# Altium schematic sheet bank226.SchDoc: Bank226
size A3; Organization: Altium Limited; Address1: L3, 12a Rodborough Rd; Address2: Frenchs Forest; Address3: NSW; Address4: Australia 2086
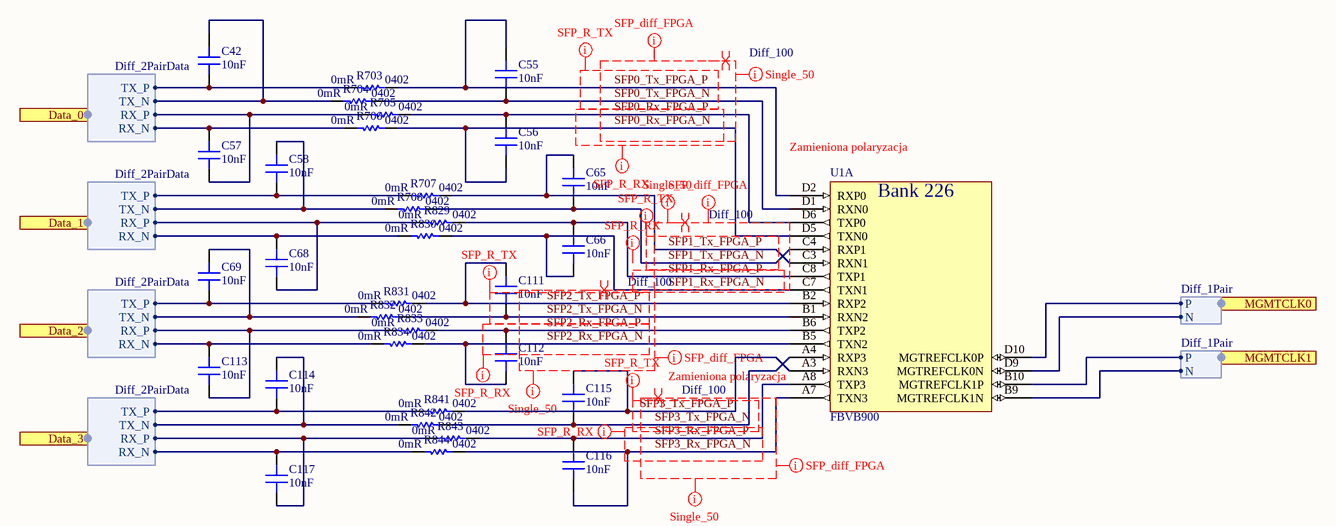
[diagram p0: bank226.SchDoc]

## Parts
C42  10nF  [CAP 0402/1005 KK]
C55  10nF  [CAP 0402/1005 KK]
C56  10nF  [CAP 0402/1005 KK]
C57  10nF  [CAP 0402/1005 KK]
C58  10nF  [CAP 0402/1005 KK]
C65  10nF  [CAP 0402/1005 KK]
C66  10nF  [CAP 0402/1005 KK]
C68  10nF  [CAP 0402/1005 KK]
C69  10nF  [CAP 0402/1005 KK]
C111  10nF  [CAP 0402/1005 KK]
C112  10nF  [CAP 0402/1005 KK]
C113  10nF  [CAP 0402/1005 KK]
C114  10nF  [CAP 0402/1005 KK]
C115  10nF  [CAP 0402/1005 KK]
C116  10nF  [CAP 0402/1005 KK]
C117  10nF  [CAP 0402/1005 KK]
R703  0mR  Case/Package: 0402  [RES 0402/1005 RF KK]
R704  0mR  Case/Package: 0402  [RES 0402/1005 RF KK]
R705  0mR  Case/Package: 0402  [RES 0402/1005 RF KK]
R706  0mR  Case/Package: 0402  [RES 0402/1005 RF KK]
R707  0mR  Case/Package: 0402  [RES 0402/1005 RF KK]
R708  0mR  Case/Package: 0402  [RES 0402/1005 RF KK]
R829  0mR  Case/Package: 0402  [RES 0402/1005 RF KK]
R830  0mR  Case/Package: 0402  [RES 0402/1005 RF KK]
R831  0mR  Case/Package: 0402  [RES 0402/1005 RF KK]
R832  0mR  Case/Package: 0402  [RES 0402/1005 RF KK]
R833  0mR  Case/Package: 0402  [RES 0402/1005 RF KK]
R834  0mR  Case/Package: 0402  [RES 0402/1005 RF KK]
R841  0mR  Case/Package: 0402  [RES 0402/1005 RF KK]
R842  0mR  Case/Package: 0402  [RES 0402/1005 RF KK]
R843  0mR  Case/Package: 0402  [RES 0402/1005 RF KK]
R844  0mR  Case/Package: 0402  [RES 0402/1005 RF KK]
U1  FBVB900  [FBVB900 XX]  (part A of 23)

## Ports
Data_0 (harness Diff_2PairData), Data_1 (harness Diff_2PairData), Data_2 (harness Diff_2PairData), Data_3 (harness Diff_2PairData), MGMTCLK0 (harness Diff_1Pair), MGMTCLK1 (harness Diff_1Pair)

## Harnesses
Diff_2PairData: RX_P, RX_N, TX_P, TX_N
Diff_1Pair: P, N

## Nets
SFP0_Rx_FPGA_N: C56.1 R706.1 U1.D5(TXN0)
SFP0_Rx_FPGA_P: C56.2 R705.1 U1.D6(TXP0)
SFP0_Tx_FPGA_N: C55.1 R704.1 U1.D1(RXN0)
SFP0_Tx_FPGA_P: C55.2 R703.1 U1.D2(RXP0)
SFP1_Rx_FPGA_N: C66.1 R830.1 U1.C7(TXN1)
SFP1_Rx_FPGA_P: C66.2 R829.1 U1.C8(TXP1)
SFP1_Tx_FPGA_N: C65.1 R708.1 U1.C4(RXP1)
SFP1_Tx_FPGA_P: C65.2 R707.1 U1.C3(RXN1)
SFP2_Rx_FPGA_N: C112.1 R834.1 U1.B5(TXN2)
SFP2_Rx_FPGA_P: C112.2 R833.1 U1.B6(TXP2)
SFP2_Tx_FPGA_N: C111.1 R832.1 U1.B1(RXN2)
SFP2_Tx_FPGA_P: C111.2 R831.1 U1.B2(RXP2)
SFP3_Rx_FPGA_N: C116.1 R844.1 U1.A7(TXN3)
SFP3_Rx_FPGA_P: C116.2 R843.1 U1.A8(TXP3)
SFP3_Tx_FPGA_N: C115.1 R842.1 U1.A4(RXP3)
SFP3_Tx_FPGA_P: C115.2 R841.1 U1.A3(RXN3)
NetC42_1: C42.1 R703.2 ; port Data_0.TX_P
NetC42_2: C42.2 R704.2 ; port Data_0.TX_N
NetC57_1: C57.1 R705.2 ; port Data_0.RX_P
NetC57_2: C57.2 R706.2 ; port Data_0.RX_N
NetC58_1: C58.1 R707.2 ; port Data_1.TX_P
NetC58_2: C58.2 R708.2 ; port Data_1.TX_N
NetC68_1: C68.1 R829.2 ; port Data_1.RX_P
NetC68_2: C68.2 R830.2 ; port Data_1.RX_N
NetC69_1: C69.1 R831.2 ; port Data_2.TX_P
NetC69_2: C69.2 R832.2 ; port Data_2.TX_N
NetC113_1: C113.1 R833.2 ; port Data_2.RX_P
NetC113_2: C113.2 R834.2 ; port Data_2.RX_N
NetC114_1: C114.1 R841.2 ; port Data_3.TX_P
NetC114_2: C114.2 R842.2 ; port Data_3.TX_N
NetC117_1: C117.1 R843.2 ; port Data_3.RX_P
NetC117_2: C117.2 R844.2 ; port Data_3.RX_N
NetU1_B9: U1.B9(MGTREFCLK1N) ; port MGMTCLK1.N
NetU1_B10: U1.B10(MGTREFCLK1P) ; port MGMTCLK1.P
NetU1_D9: U1.D9(MGTREFCLK0N) ; port MGMTCLK0.N
NetU1_D10: U1.D10(MGTREFCLK0P) ; port MGMTCLK0.P

## Layout directives
differential pair; differential pair class Diff_100: SFP0_Rx_FPGA_N, SFP0_Rx_FPGA_P, SFP0_Tx_FPGA_N, SFP0_Tx_FPGA_P, SFP1_Rx_FPGA_N, SFP1_Rx_FPGA_P, SFP1_Tx_FPGA_N, SFP1_Tx_FPGA_P, SFP2_Rx_FPGA_N, SFP2_Rx_FPGA_P, SFP2_Tx_FPGA_N, SFP2_Tx_FPGA_P, SFP3_Rx_FPGA_N, SFP3_Rx_FPGA_P, SFP3_Tx_FPGA_N
net class SFP_diff_FPGA: SFP0_Rx_FPGA_N, SFP0_Rx_FPGA_P, SFP0_Tx_FPGA_N, SFP0_Tx_FPGA_P, SFP1_Rx_FPGA_N, SFP1_Rx_FPGA_P, SFP1_Tx_FPGA_N, SFP1_Tx_FPGA_P, SFP2_Rx_FPGA_N, SFP2_Rx_FPGA_P, SFP2_Tx_FPGA_N, SFP2_Tx_FPGA_P, SFP3_Rx_FPGA_N, SFP3_Rx_FPGA_P, SFP3_Tx_FPGA_N
net class Single_50: SFP0_Rx_FPGA_N, SFP0_Rx_FPGA_P, SFP0_Tx_FPGA_N, SFP0_Tx_FPGA_P, SFP1_Rx_FPGA_N, SFP1_Rx_FPGA_P, SFP1_Tx_FPGA_N, SFP1_Tx_FPGA_P, SFP2_Rx_FPGA_N, SFP2_Rx_FPGA_P, SFP2_Tx_FPGA_N, SFP2_Tx_FPGA_P, SFP3_Rx_FPGA_N, SFP3_Rx_FPGA_P, SFP3_Tx_FPGA_N
net class SFP_R_RX: (no net found under the mark), SFP0_Rx_FPGA_N, SFP0_Rx_FPGA_P, SFP2_Rx_FPGA_N, SFP2_Rx_FPGA_P, SFP3_Rx_FPGA_N, SFP3_Rx_FPGA_P
net class SFP_R_TX: SFP0_Tx_FPGA_N, SFP0_Tx_FPGA_P, SFP1_Tx_FPGA_N, SFP1_Tx_FPGA_P, SFP2_Tx_FPGA_N, SFP2_Tx_FPGA_P, SFP3_Tx_FPGA_N, SFP3_Tx_FPGA_P

## Notes on the sheet
- (near U1) Zamieniona polaryzacja
- Title
- Size:
- Date:
- A3
- Number:
- Time:
- Revision:
- Sheet
- of
- File:
- (in symbol FBVB900, part A) Bank 226

## Library data of the parts
C42 C55-C58 C65 C66 C68 C69 C111-C117 = Capacitor: Manufacturer: KEMET; Manufacturer Part Number: C0402C103K4RACTU; Dielectric Material: Ceramic; Tolerance: 10%; Voltage Rating (DC): 16V; Dielectric: X7R; Dissipation Factor: 3.5%; Supplier 1: Digi-Key; Supplier Part Number 1: 399-1038-1-ND; Stock 1: 1112674; Pricing 1: 1 = 0,10000, 10 = 0,02800, 100 = 0,01240, 500 = 0,00886, 1000 = 0,00696, 2500 = 0,00632, 5000 = 0,00582 (USD); RoHS: Yes; Mount: Surface Mount,PCB; Case/Package: 0402; Number of Pins: 2; Case Code (Metric): 1005; Case Code (Imperial): 0402; Contact Plating: Tin,Matte; Min Operating Temperature: -55°C; Max Operating Temperature: 125°C; Capacitance: 10nF; Packaging: Tape and Reel; Package Quantity: 1; Voltage Rating: 16V; Termination: SMD/SMT; Voltage: 16V; Length: 1mm; Height: 0.5mm; Width: 0.02inch; Depth: 0.5mm; Thickness: 0.022inch; Lead Pitch: 0.3mm; Radiation Hardening: No; REACH SVHC: No SVHC; ComponentLink1URL: https://datasheet.ciiva.com/14595/70095383-14595321.pdf?src-supplier=Allied+Electronics; ComponentLink1Description: https://datasheet.ciiva.com/14595/70095383-14595321.pdf?src-supplier=Allied+Electronics; ComponentLink2URL: https://datasheet.ciiva.com/7747/kem-c1002-x7r-smd-7747614.pdf?src-supplier=Element14; ComponentLink2Description: https://datasheet.ciiva.com/7747/kem-c1002-x7r-smd-7747614.pdf?src-supplier=Element14
R703-R708 R829-R834 R841-R844 = Resistor: Manufacturer 1: Yageo; Manufacturer Part Number 1: RC0402JR-070RL; Power Rating: 62.5mW; Tolerance: 5%; Voltage Rating: 50V; Max Power Dissipation: 63mW; Temperature Coefficient: 200ppm/°C; Supplier 1: Digi-Key; Supplier Part Number 1: 311-0.0JRCT-ND; Stock 1: 69822252; Pricing 1: 1=0.10000, 10=0.01200, 25=0.00920, 50=0.00680, 100=0.00510, 250=0.00388, 500=0.00308, 1000=0.00227, 5000=0.00163 (USD); RoHS: Yes; Contact Plating: Tin,Matte; Case Code (Metric): 1005; Case Code (Imperial): 0402; Min Operating Temperature: -55°C; Max Operating Temperature: 155°C; Resistance: 0mR; Packaging: Tape and Reel; Composition: Thick Film; Package Quantity: 1; Number of Terminations: 2; Termination: SMD/SMT; Military Standard: Not; Features: Moisture Resistant; Length: 1mm; Height: 0.016inch; Width: 0.02inch; Depth: 0.5mm; Radiation Hardening: No; REACH SVHC: Unknown; Lead Free: Lead Free; ComponentLink1URL: https://datasheet.ciiva.com/2452/pyu-rc0402-51-rohs-l-6-2452608.pdf?src-supplier=Digi-Key; ComponentLink1Description: https://datasheet.ciiva.com/2452/pyu-rc0402-51-rohs-l-6-2452608.pdf?src-supplier=Digi-Key; ComponentLink2URL: https://datasheet.ciiva.com/11808/0900766b80c66297-11808195.pdf?src-supplier=RSComponents; ComponentLink2Description: https://datasheet.ciiva.com/11808/0900766b80c66297-11808195.pdf?src-supplier=RSComponents; ComponentLink3URL: https://datasheet.ciiva.com/2452/pyu-r-int-thick-7-2452609.pdf?src-supplier=Digi-Key; ComponentLink3Description: https://datasheet.ciiva.com/2452/pyu-r-int-thick-7-2452609.pdf?src-supplier=Digi-Key; ComponentLink4URL: https://datasheet.ciiva.com/22747/1018594-22747515.pdf?src-supplier=Element14; ComponentLink4Description: https://datasheet.ciiva.com/22747/1018594-22747515.pdf?src-supplier=Element14; ComponentLink5URL: https://datasheet.ciiva.com/7983/1018594-7983535.pdf?src-supplier=Element14; ComponentLink5Description: https://datasheet.ciiva.com/7983/1018594-7983535.pdf?src-supplier=Element14; ComponentLink6URL: https://datasheet.ciiva.com/2452/pyu-r-int-thick-7-2452610.pdf?src-supplier=Digi-Key; ComponentLink6Description: https://datasheet.ciiva.com/2452/pyu-r-int-thick-7-2452610.pdf?src-supplier=Digi-Key; ComponentLink7URL: https://datasheet.ciiva.com/8896/pyu-rc0402-51-rohs-l-6-8896201.pdf?src-supplier=Avnet; ComponentLink7Description: https://datasheet.ciiva.com/8896/pyu-rc0402-51-rohs-l-6-8896201.pdf?src-supplier=Avnet; ComponentLink8URL: https://datasheet.ciiva.com/28386/pyu-rc0402-51-rohs-l-6-28386633.pdf?src-supplier=Avnet+Europe; ComponentLink8Description: https://datasheet.ciiva.com/28386/pyu-rc0402-51-rohs-l-6-28386633.pdf?src-supplier=Avnet+Europe; ComponentLink9URL: https://datasheet.ciiva.com/15189/getdatasheetpartid-326379-15189533.pdf?src-supplier=Verical; ComponentLink9Description: https://datasheet.ciiva.com/15189/getdatasheetpartid-326379-15189533.pdf?src-supplier=Verical
U1 = FBVB900: FPGA Zynq UltraScale+ Family 192150 Cells 20nm Technology 0.85V 900-Pin FCBGA Tray; Manufacturer Part Number: XCZU4CG-1FBVB900E; Manufacturer: Xilinx; Peripherals: WDT,DMA; Interface: I2C,SPI,USB,Ethernet,MMC,SDIO,SD,UART,USART,EBI/EMI; Core Architecture: ARM; RAM Size: 256KB; Frequency: 500MHz; Number of I/Os: 204; Supplier 1: Mouser; Supplier Part Number 1: 217-CZU4CG-1FBVB900E; Stock 1: 3; Pricing 1: 1=0,00000, 5=1060,70000 (USD); RoHS: No; Case/Package: FCBGA; Min Operating Temperature: 0°C; Max Operating Temperature: 100°C; Packaging: Tray; ComponentLink1URL: https://www.xilinx.com/support/documentation/data_sheets/ds891-zynq-ultrascale-plus-overview.pdf?src-supplier=Digi-Key; ComponentLink1Description: https://www.xilinx.com/support/documentation/data_sheets/ds891-zynq-ultrascale-plus-overview.pdf?src-supplier=Digi-Key; ComponentLink2URL: https://www.xilinx.com/support/documentation/data_sheets/ds925-zynq-ultrascale-plus.pdf?src-supplier=Digi-Key; ComponentLink2Description: https://www.xilinx.com/support/documentation/data_sheets/ds925-zynq-ultrascale-plus.pdf?src-supplier=Digi-Key; Supplier 2: Avnet; Supplier 3: Digi-Key; Supplier Part Number 2: XCZU4CG-1FBVB900E; Supplier Part Number 3: XCZU4CG-1FBVB900E-ND